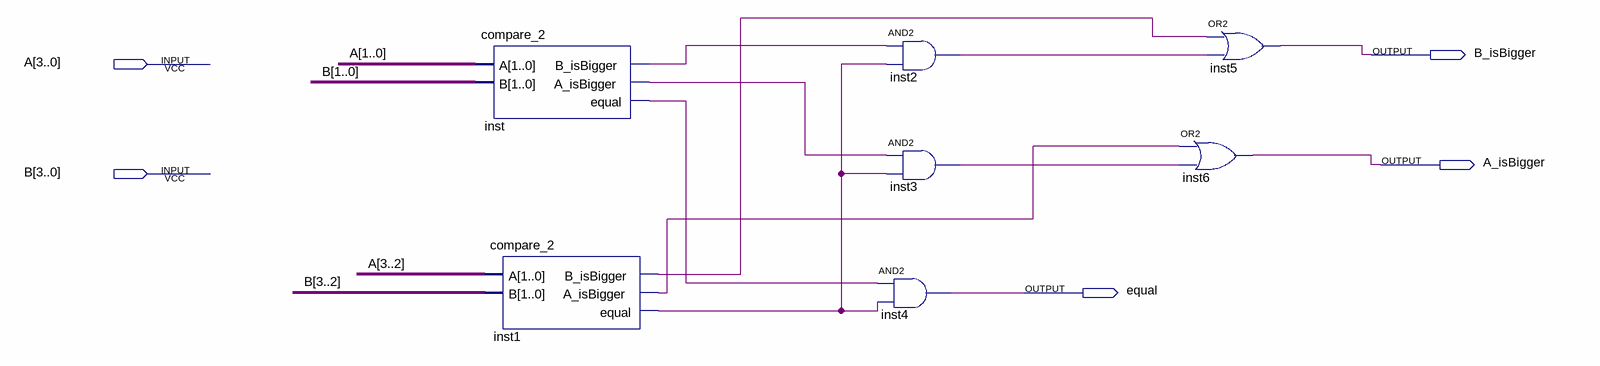
[diagram p0: schematic sheet]
// Quartus schematic compare_4.bdf as structural Verilog: 7 symbols, 5 pins
module compare_4 (
  input  [3:0] A,
  input  [3:0] B,
  output B_isBigger,
  output A_isBigger,
  output equal
);

  wire inst1_a_isbigger, inst1_b_isbigger, inst1_equal, inst2_out, inst3_out, inst_a_isbigger,
       inst_b_isbigger, inst_equal;

  compare_2 inst (
    .A(A[1:0]), .B(B[1:0]), .B_isBigger(inst_b_isbigger), .A_isBigger(inst_a_isbigger), .equal(inst_equal));
  compare_2 inst1 (
    .A(A[3:2]), .B(B[3:2]), .B_isBigger(inst1_b_isbigger), .A_isBigger(inst1_a_isbigger), .equal(inst1_equal));
  and inst2 (inst2_out, inst_b_isbigger, inst1_equal);
  and inst3 (inst3_out, inst_a_isbigger, inst1_equal);
  and inst4 (equal, inst_equal, inst1_equal);
  or inst5 (B_isBigger, inst1_b_isbigger, inst2_out);
  or inst6 (A_isBigger, inst1_a_isbigger, inst3_out);
endmodule
